# Altium schematic sheet Connector_Sheet_4.SchDoc
size A4; SheetNumber: 5; SheetTotal: 12
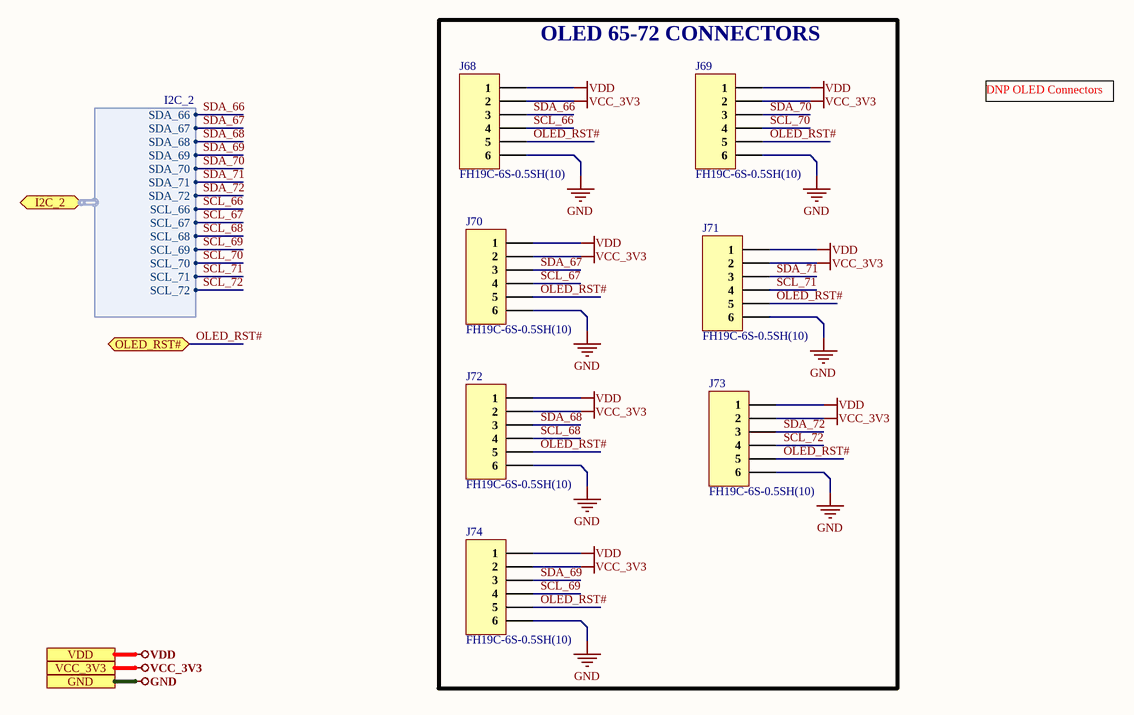
[diagram p0: Connector_Sheet_4.SchDoc]

## Parts
J68  FH19C-6S-0.5SH(10)  [FH19C-6S-0.5SH(10)]
J69  FH19C-6S-0.5SH(10)  [FH19C-6S-0.5SH(10)]
J70  FH19C-6S-0.5SH(10)  [FH19C-6S-0.5SH(10)]
J71  FH19C-6S-0.5SH(10)  [FH19C-6S-0.5SH(10)]
J72  FH19C-6S-0.5SH(10)  [FH19C-6S-0.5SH(10)]
J73  FH19C-6S-0.5SH(10)  [FH19C-6S-0.5SH(10)]
J74  FH19C-6S-0.5SH(10)  [FH19C-6S-0.5SH(10)]

## Blocks framed on the sheet
OLED 65-72 CONNECTORS: J68-J74

## Ports
GND, I2C_2 (bidir, harness I2C_2), OLED_RST# (bidir), VCC_3V3, VDD

## Harnesses
I2C_2: SDA_66, SDA_67, SDA_68, SDA_69, SDA_70, SDA_71, SDA_72, SCL_66, SCL_67, SCL_68, SCL_69, SCL_70, SCL_71, SCL_72

## Nets
GND: J68.6 J69.6 J70.6 J71.6 J72.6 J73.6 J74.6 ; port GND
VCC_3V3: J68.2 J69.2 J70.2 J71.2 J72.2 J73.2 J74.2 ; port VCC_3V3
VDD: J68.1 J69.1 J70.1 J71.1 J72.1 J73.1 J74.1 ; port VDD
OLED_RST#: J68.5 J69.5 J70.5 J71.5 J72.5 J73.5 J74.5 ; port OLED_RST#
SCL_66: J68.4 ; port I2C_2.SCL_66
SCL_67: J70.4 ; port I2C_2.SCL_67
SCL_68: J72.4 ; port I2C_2.SCL_68
SCL_69: J74.4 ; port I2C_2.SCL_69
SCL_70: J69.4 ; port I2C_2.SCL_70
SCL_71: J71.4 ; port I2C_2.SCL_71
SCL_72: J73.4 ; port I2C_2.SCL_72
SDA_66: J68.3 ; port I2C_2.SDA_66
SDA_67: J70.3 ; port I2C_2.SDA_67
SDA_68: J72.3 ; port I2C_2.SDA_68
SDA_69: J74.3 ; port I2C_2.SDA_69
SDA_70: J69.3 ; port I2C_2.SDA_70
SDA_71: J71.3 ; port I2C_2.SDA_71
SDA_72: J73.3 ; port I2C_2.SDA_72

## Notes on the sheet
- DNP OLED Connectors
- 1
- Huzaifa Ali

## Library data of the parts
J68-J74 = FH19C-6S-0.5SH(10): 0.5mm Pitch, 0.9mm Height, No of Contact 4-50, FPC/FFC Connector, 0.5 A, -55 to 85 ℃, RoHS; Manufacturer: Hirose; Supplier 1: Digi-Key; Manufacturer Part Number: FH19C-6S-0.5SH(10); RoHS: Yes; Category: FFC / FPC; Stock 1: 1159; Pricing 1: 1=1.10000, 10=0.96900, 25=0.91200, 50=0.87400, 100=0.83600, 250=0.76000, 500=0.68400, 1000=0.60800, 2500=0.55100 (USD); ComponentLink1URL: https://datasheet.ciiva.com/18563/ed-fh19cfh19sc-20140305-18563530.pdf?src-supplier=Digi-Key; ComponentLink1Description: https://datasheet.ciiva.com/18563/ed-fh19cfh19sc-20140305-18563530.pdf?src-supplier=Digi-Key; Supplier Part Number 1: H125824CT-ND